# EasyEDA Pro project ProPrj_电刺激+主控_2026-05-06.epro, board PCB1
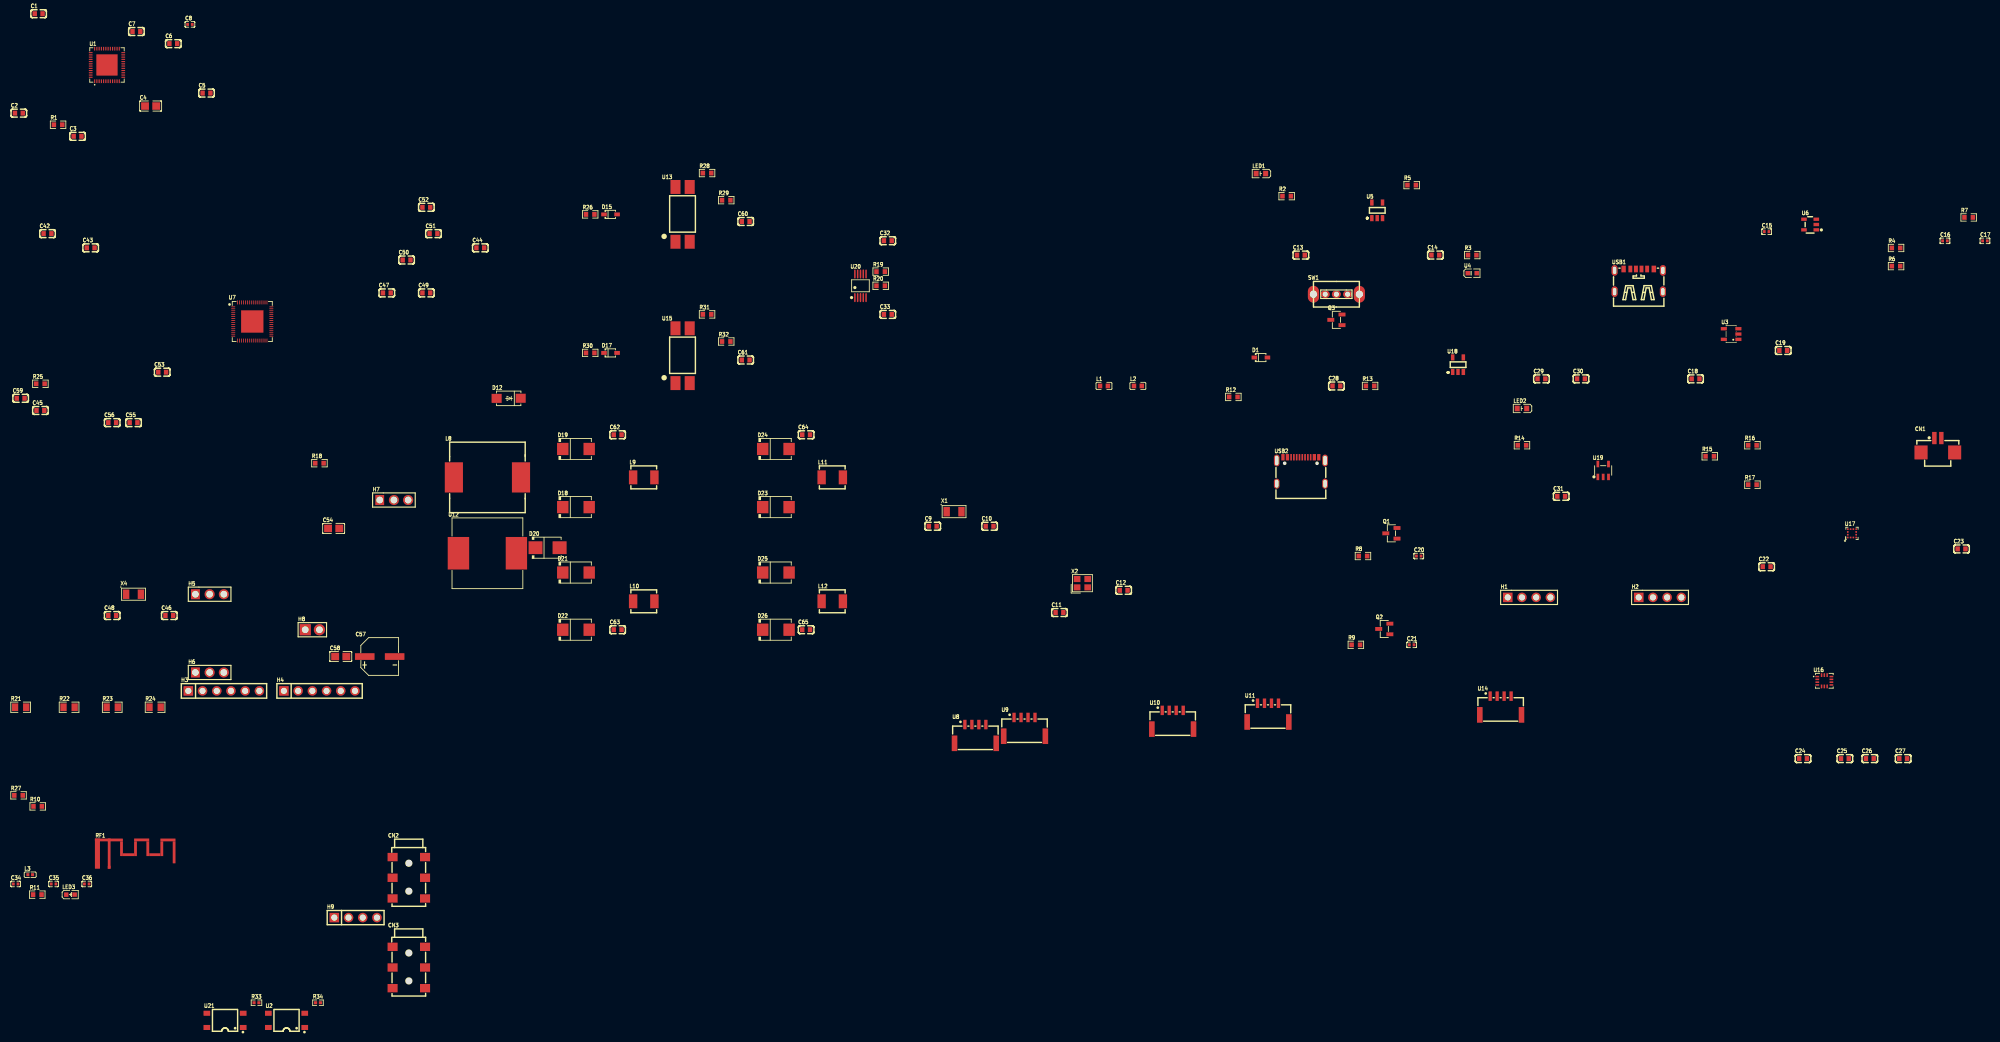
[diagram p2: board, top side]
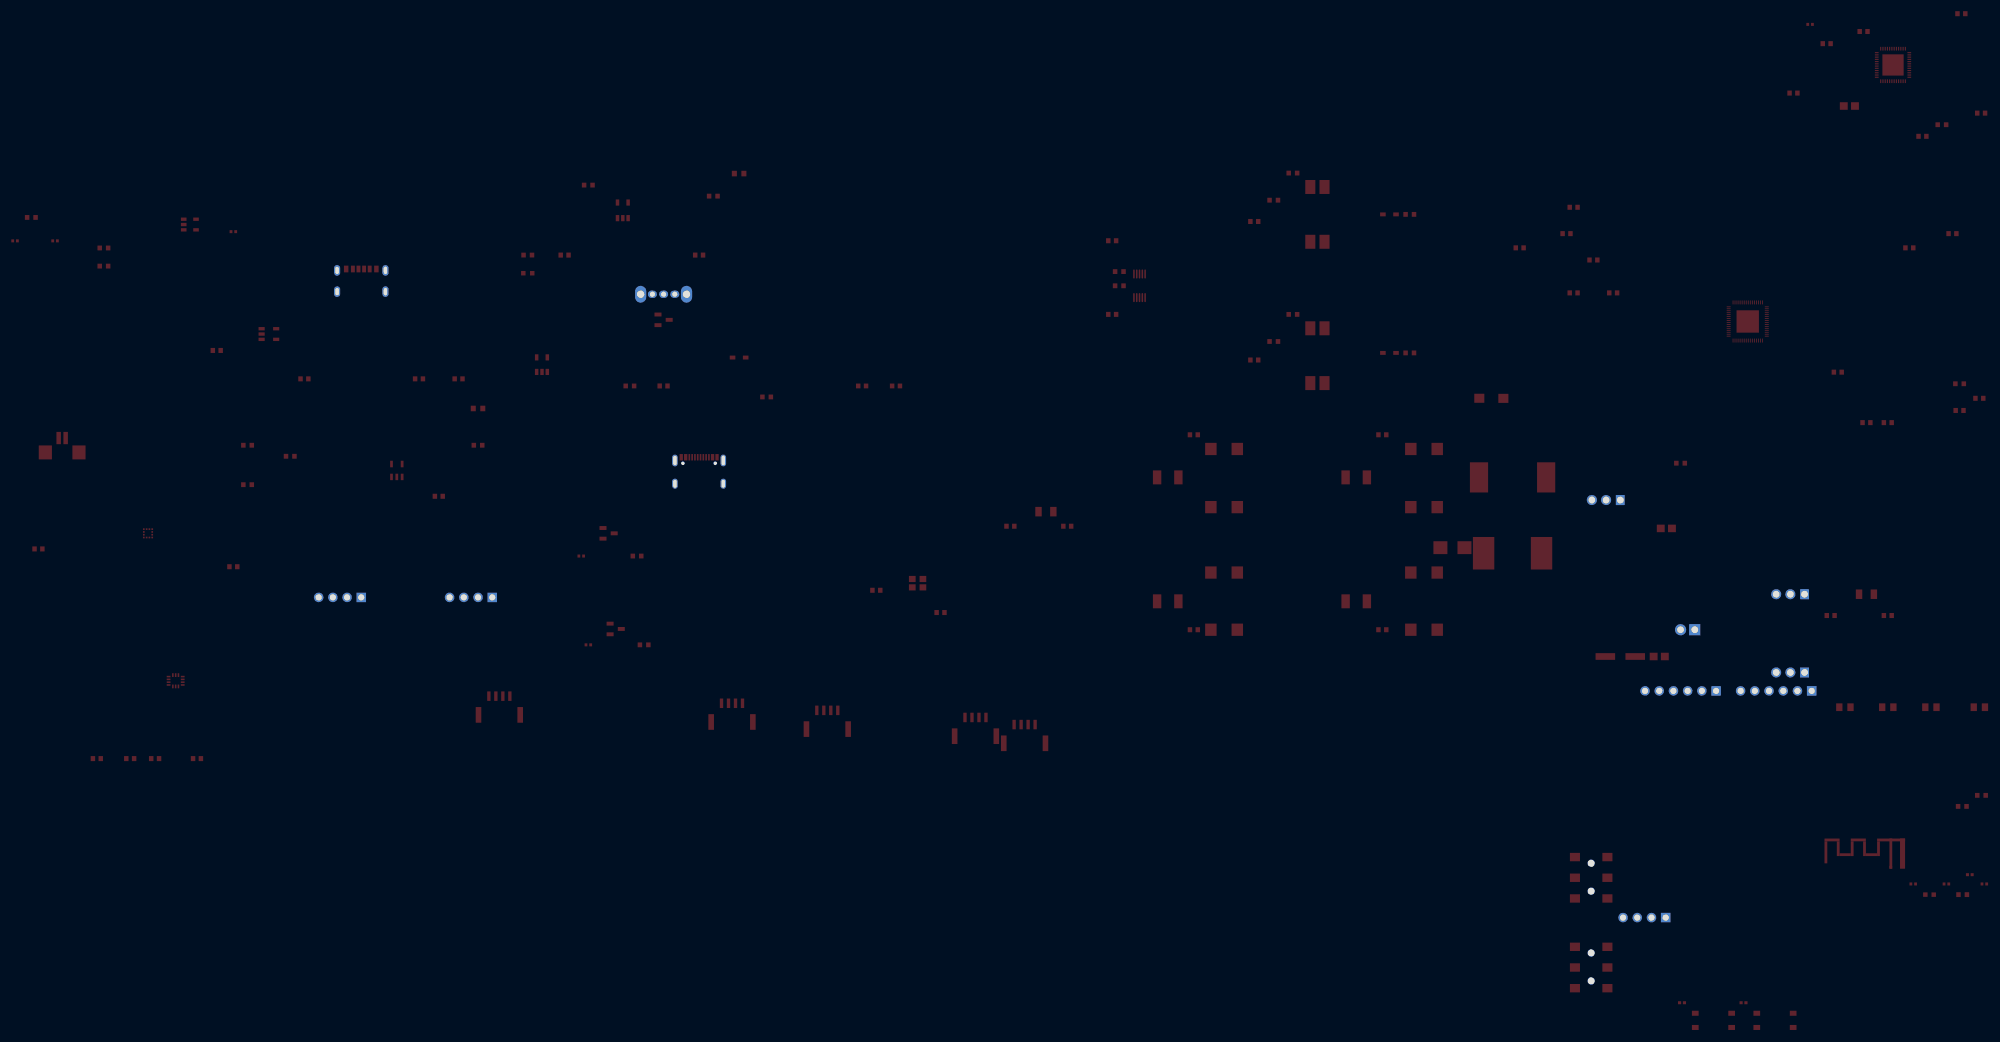
[diagram p3: board, bottom side, seen from below]

Outline 163.28 x 93.55 mm; copper layers: Top Layer, Bottom Layer. Coordinates in mm from the lower left corner of the outline.
Stack: Top Layer 0.035mm / Dielectric1 1.51mm FR4 er 4.5 / Bottom Layer 0.035mm

## Design rules (mm)
spacing copperThickness1oz (default): track to track 0.102, other pairs 0.152 to 0.3
spacing copperThickness2oz: track to track 0.203, other pairs 0.152 to 0.3
track width copperThickness1oz (default): min 0.127, default 0.254, max 2.54
track width copperThickness2oz: min 0.203, default 0.254, max 2.54
differential pair differentialPair (default): width min 0.127, default 0.254, max 2.54; gap min 0.152, default 0.152

## Placement (name value [footprint] x y rotation side)
C1  100nF  [C0603]  -65.51 173.62 0 top
C2  100nF  [C0603]  -69.05 155.84 0 top
C3  100nF  [C0603]  -58.56 151.7 0 top
C4  NC  [C0805]  -45.5 157.11 0 top
C5  100pF  [C0603]  -35.51 159.43 0 top
C6  100nF  [C0603]  -41.44 168.27 0 top
C7  1uF  [C0603]  -48.04 170.44 0 top
C8  10uF  [C0402]  -38.47 171.71 0 top
C9  12pF  [C0603]  94.28 81.96 0 top
C10  12pF  [C0603]  104.44 81.96 0 top
C11  12pF  [C0603]  116.92 66.53 0 top
C12  12pF  [C0603]  128.39 70.51 0 top
C13  4.7uF  [C0603]  160.06 130.46 0 top
C14  4.7uF  [C0603]  184.1 130.46 0 top
C15  10uF  [C0402]  243.3 134.65 0 top
C16  10uF  [C0402]  275.17 133 0 top
C17  10uF  [C0402]  282.32 133 0 top
C18  1uF  [C0603]  230.6 108.32 0 top
C19  1uF  [C0603]  246.27 113.4 0 top
C20  10uF  [C0402]  181.13 76.63 0 top
C21  10uF  [C0402]  179.86 60.75 0 top
C22  220nF  [C0603]  243.3 74.72 0 top
C23  100nF  [C0603]  278.13 77.9 0 top
C24  100nF  [C0603]  249.8 40.41 0 top
C25  100nF  [C0603]  257.28 40.41 0 top
C26  100nF  [C0603]  261.74 40.41 0 top
C27  100nF  [C0603]  267.7 40.41 0 top
C28  10uF  [C0603]  166.41 107.05 0 top
C29  10uF  [C0603]  203.05 108.32 0 top
C30  100nF  [C0603]  210.12 108.32 0 top
C31  10uF  [C0603]  206.59 87.32 0 top
C32  100nF  [C0603]  86.24 133.02 0 top
C33  100nF  [C0603]  86.24 119.85 0 top
C34  0.8pF  [C0402]  -69.61 17.99 0 top
C35  nc  [C0402]  -62.84 17.99 0 top
C36  1.2pF  [C0402]  -56.91 17.99 0 top
C42  100nF  [C0603]  -63.92 134.29 0 top
C43  100nF  [C0603]  -56.21 131.75 0 top
C44  100nF  [C0603]  13.42 131.75 0 top
C45  100nF  [C0603]  -65.19 102.67 0 top
C46  15pF  [C0603]  -42.16 65.99 0 top
C47  1uF  [C0603]  -3.29 123.69 0 top
C48  15pF  [C0603]  -52.36 65.99 0 top
C49  100nF  [C0603]  3.78 123.69 0 top
C50  100nF  [C0603]  0.25 129.58 0 top
C51  1uF  [C0603]  5.05 134.29 0 top
C52  100nF  [C0603]  3.78 139 0 top
C53  100nF  [C0603]  -43.43 109.52 0 top
C54  10uF  [C0805]  -12.79 81.57 0 top
C55  100nF  [C0603]  -48.55 100.49 0 top
C56  100nF  [C0603]  -52.36 100.49 0 top
C57  22uF  [CAP-SMD_BD6.3-L6.6-W6.6-LS7.3-FD-H7.7]  -4.56 58.67 0 top
C58  100nF  [C0805]  -11.52 58.67 0 top
C59  1uF  [C0603]  -68.73 104.84 0 top
C60  10nF  [C0603]  60.85 136.46 0 top
C61  10nF  [C0603]  60.85 111.69 0 top
C62  10nF  [C0603]  37.96 98.32 0 top
C63  10nF  [C0603]  37.96 63.45 0 top
C64  10nF  [C0603]  71.65 98.32 0 top
C65  10nF  [C0603]  71.65 63.45 0 top
CN1  HC-1.25-2PWT  [CONN-SMD_2P-P1.25-HC-1.25-2PWT]  273.9 96.45 0 top
CN2  PJ-242  [AUDIO-SMD_PJ-242_1]  0.65 19.09 0 top
CN3  PJ-242  [AUDIO-SMD_PJ-242_1]  0.65 3.05 0 top
D1  1N5819WS  [SOD-323_L1.8-W1.3-LS2.5-RD]  152.92 112.13 0 top
D12  SS26  [SMA_L4.3-W2.6-LS5.0-FD]  18.49 104.84 0 top
D15  1N4148WS  [SOD-323_L1.8-W1.3-LS2.5-RD]  36.69 137.73 0 top
D17  1N4148WS  [SOD-323_L1.8-W1.3-LS2.5-RD]  36.69 112.96 0 top
D18  SMBJ60A  [SMB_L4.5-W3.7-LS5.4-RD]  30.52 85.38 0 top
D19  SMBJ60A  [SMB_L4.5-W3.7-LS5.4-RD]  30.52 95.78 0 top
D20  SMBJ85A  [SMB_L4.3-W3.6-LS5.3-RD]  25.44 78.13 0 top
D21  SMBJ60A  [SMB_L4.5-W3.7-LS5.4-RD]  30.52 73.68 0 top
D22  SMBJ60A  [SMB_L4.5-W3.7-LS5.4-RD]  30.52 63.45 0 top
D23  SMBJ60A  [SMB_L4.5-W3.7-LS5.4-RD]  66.25 85.38 0 top
D24  SMBJ60A  [SMB_L4.5-W3.7-LS5.4-RD]  66.25 95.78 0 top
D25  SMBJ60A  [SMB_L4.5-W3.7-LS5.4-RD]  66.25 73.68 0 top
D26  SMBJ60A  [SMB_L4.5-W3.7-LS5.4-RD]  66.25 63.45 0 top
H1  PH2.54-01-04PZD  [HDR-TH_4P-P2.54-V-M-1]  200.85 69.24 0 top
H2  PH2.54-01-04PZD  [HDR-TH_4P-P2.54-V-M-1]  224.25 69.24 0 top
H3  PZ254V-11-06P  [HDR-TH_6P-P2.54-V-M]  -32.41 52.52 0 top
H4  PZ254V-11-06P  [HDR-TH_6P-P2.54-V-M]  -15.33 52.52 0 top
H5  12251103CNG0S115001  [HDR-TH_3P-P2.54-V-M-1]  -34.95 69.8 0 top
H6  12251103CNG0S115001  [HDR-TH_3P-P2.54-V-M-1]  -34.95 55.81 0 top
H7  12251103CNG0S115001  [HDR-TH_3P-P2.54-V-M-1]  -2.02 86.65 0 top
H8  PZ254V-11-02P  [HDR-TH_2P-P2.54-V-M]  -16.6 63.45 0 top
H9  PZ254V-11-04P  [HDR-TH_4P-P2.54-V-M]  -8.86 11.97 0 top
L1  10uH  [L0603]  124.88 107.05 0 top
L2  15uH  [L0603]  130.93 107.05 0 top
L3  3.9nH  [L0402]  -67.02 19.65 0 top
L8  100uH  [IND-SMD_L12.6-W13.5]  14.69 90.7 0 top
L9  22uH  [IND-SMD_L4.6-W4.1-A]  42.63 90.7 0 top
L10  22uH  [IND-SMD_L4.6-W4.1-A]  42.63 68.53 0 top
L11  22uH  [IND-SMD_L4.6-W4.1-A]  76.32 90.7 0 top
L12  22uH  [IND-SMD_L4.6-W4.1-A]  76.32 68.53 0 top
LED1  GL0603UR01  [LED0603-FD]  152.92 145.03 0 top
LED2  GL0603UR01  [LED0603-FD]  199.58 103.02 0 top
LED3  GL0603UB01  [LED0603-RD_BLUE]  -59.82 16.08 0 top
Q1  NX2301P,215  [SOT-23-3_L2.9-W1.3-P1.90-LS2.4-BR]  176.24 80.69 0 top
Q2  NX2301P,215  [SOT-23-3_L2.9-W1.3-P1.90-LS2.4-BR]  174.97 63.59 0 top
Q3  SI2301  [SOT-23-3_L2.9-W1.3-P1.90-LS2.4-BR]  166.41 118.88 0 top
R1  10kΩ  [R0603]  -62.04 153.77 0 top
R2  470Ω  [R0603]  157.52 141 0 top
R3  20kΩ  [R0603]  190.69 130.46 0 top
R4  348kΩ  [R0603]  266.43 131.73 0 top
R5  10kΩ  [R0603]  179.86 142.97 0 top
R6  100kΩ  [R0603]  266.43 128.48 0 top
R7  0Ω  [R0603]  279.4 137.19 0 top
R8  47kΩ  [R0603]  171.16 76.63 0 top
R9  47kΩ  [R0603]  169.89 60.75 0 top
R10  4.7kΩ  [R0603]  -65.68 31.86 0 top
R11  15kΩ  [R0603]  -65.75 16.08 0 top
R12  100kΩ  [R0603]  148 105.08 0 top
R13  10kΩ  [R0603]  172.43 107.05 0 top
R14  1kΩ  [R0603]  199.58 96.45 0 top
R15  4.7kΩ  [R0603]  233.14 94.47 0 top
R16  1.1MΩ  [R0603]  240.76 96.45 0 top
R17  1.1MΩ  [R0603]  240.76 89.39 0 top
R18  0Ω  [R0603]  -15.33 93.24 0 top
R19  1kΩ  [R0603]  84.97 127.5 0 top
R20  1kΩ  [R0603]  84.97 124.96 0 top
R21  0Ω  [R0805]  -68.73 49.59 0 top
R22  0Ω  [R0805]  -60.07 49.59 0 top
R23  0Ω  [R0805]  -52.36 49.59 0 top
R24  0Ω  [R0805]  -44.7 49.59 0 top
R25  10kΩ  [R0603]  -65.19 107.44 0 top
R26  10kΩ  [R0603]  33.06 137.73 0 top
R27  4.7kΩ  [R0603]  -69.1 33.83 0 top
R28  10kΩ  [R0603]  53.95 145.12 0 top
R29  1kΩ  [R0603]  57.37 140.27 0 top
R30  10kΩ  [R0603]  33.06 112.96 0 top
R31  10kΩ  [R0603]  53.95 119.85 0 top
R32  1kΩ  [R0603]  57.37 115 0 top
R33  330Ω  [R0402]  -26.58 -3.26 0 top
R34  330Ω  [R0402]  -15.59 -3.26 0 top
RF1  RF_2.4G_ANT  [天线封装]  -53.95 21.09 0 top
SW1  SS-12D02-VG4  [SW-TH_SS-12D02-VG4]  166.41 123.45 0 top
U1  NRF52832-QFAA-R  [QFN-48_L6.0-W6.0-P0.40-BL-EP3.8]  -53.3 164.46 0 top
U2  KAQY214STLD  [SOP-4_L3.9-W4.4-P2.54-LS7.0-BR]  -21.21 -6.41 0 top
U3  AP2127K-1.8TRG1  [SOT-23-5_L3.0-W1.7-P0.95-LS2.8-BR]  236.95 116.34 0 top
U4  PSC-1608U52GC-G4  [LED0603-RD_GREEN]  190.69 127.21 0 top
U5  XC6802A42XMR-G  [SOT-25-5_L3.0-W1.8-P0.95-LS3.0-BL]  173.7 138.46 0 top
U6  JSM2019-ADJYN5G/TR  [SOT-23-5_L2.9-W1.6-P0.95-LS2.8-BR]  251.07 135.92 0 top
U7  NNC6121  [QFN-64_L7.0-W7.0-P0.35-TL-EP4.0]  -27.33 118.58 0 top
U8  WAFER-GH1.25-4PLB  [CONN-SMD_4P-P1.25_XUNPU_WAFER-GH1.25-4PLB]  101.9 44.82 0 top
U9  WAFER-GH1.25-4PLB  [CONN-SMD_4P-P1.25_XUNPU_WAFER-GH1.25-4PLB]  110.68 46.09 0 top
U10  WAFER-GH1.25-4PLB  [CONN-SMD_4P-P1.25_XUNPU_WAFER-GH1.25-4PLB]  137.16 47.36 0 top
U11  WAFER-GH1.25-4PLB  [CONN-SMD_4P-P1.25_XUNPU_WAFER-GH1.25-4PLB]  154.19 48.63 0 top
U12  470uH  [IND-SMD_L12.5-W12.5]  14.69 77.13 0 top
U13  LTV816D-S  [SOP-4_L6.5-W4.6-P2.54-LS10.2-BL]  49.57 137.73 0 top
U14  WAFER-GH1.25-4PLB  [CONN-SMD_4P-P1.25_XUNPU_WAFER-GH1.25-4PLB]  195.77 49.9 0 top
U15  LTV816D-S  [SOP-4_L6.5-W4.6-P2.54-LS10.2-BL]  49.57 112.46 0 top
U16  LSM6DS3TR-C  [LGA-14_L3.0-W2.5-P0.50-TL]  253.61 54.33 0 top
U17  LIS2MDLTR  [VLGA-12_L2.0-W2.0-P0.50-BL]  258.55 80.69 0 top
U18  AP2112K-3.3TRG1  [SOT-25-5_L2.9-W1.6-P0.95-LS2.8-BL]  188.15 110.86 0 top
U19  MCP73831T-2ACI/OT  [SOT-23-5_L3.0-W1.7-P0.95-LS2.8-BL]  214.09 91.93 0 top
U20  CH340E  [MSOP-10_L3.0-W3.0-P0.50-LS5.0-BL]  81.36 124.96 0 top
U21  KAQY214STLD  [SOP-4_L3.9-W4.4-P2.54-LS7.0-BR]  -32.2 -6.41 0 top
USB1  TYPE-C 6P  [TYPE-C-SMD_TYPE-C-6P_1]  220.44 125.94 0 top
USB2  TYPE-C16PIN  [USB-C-SMD_TYPE-C16PIN]  160.06 91.93 0 top
X1  32.768kHz  [OSC-SMD_2P-L3.2-W1.5]  98.09 84.57 0 top
X2  32MHz  [CRYSTAL-SMD_4P-L2.5-W2.0-BL]  121.02 71.78 0 top
X4  32.768kHz  [OSC-SMD_2P-L3.2-W1.5]  -48.55 69.8 0 top

## Footprints (pads in the part's own frame, mm; a bottom-side part is the same pattern mirrored in y, then rotated)
AUDIO-SMD_PJ-242_1
  rect 1.8x1.5 smd: 2(2.9,3.7) 3(-2.9,3.7) 4(2.9,0) 5(2.9,-3.7) 6(-2.9,0) 7(-2.9,-3.7)
C0402
  rect 0.5x0.54 smd: 1(-0.42,0) 2(0.42,0)
C0603
  rect 0.8x0.9 smd: 1(-0.7,0) 2(0.7,0)
C0805
  rect 1.41x1.35 smd: 1(-1,0) 2(1,0)
CAP-SMD_BD6.3-L6.6-W6.6-LS7.3-FD-H7.7
  rect 3.5x1.2 smd: 1(-2.67,0) 2(2.67,0)
CONN-SMD_2P-P1.25-HC-1.25-2PWT
  rect 0.8x2.2 smd: 1(-0.625,1.285) 2(0.625,1.285)
  rect 2.35x2.5 smd: 3(-3.005,-1.285) 4(3.005,-1.285)
CONN-SMD_4P-P1.25_XUNPU_WAFER-GH1.25-4PLB
  rect 0.6x1.7 smd: 1(-1.875,1.675) 2(-0.625,1.675) 3(0.625,1.675) 4(1.875,1.675)
  rect 1x2.8 smd: 5(-3.725,-1.675) 6(3.725,-1.675)
CRYSTAL-SMD_4P-L2.5-W2.0-BL
  rect 1.2x1.1 smd: 1(-0.95,-0.75) 2(0.95,-0.75) 3(0.95,0.75) 4(-0.95,0.75)
HDR-TH_2P-P2.54-V-M
  rect 2x2 hole 1.2: 1(-1.27,0)
  round 2 hole 1.2: 2(1.27,0)
HDR-TH_3P-P2.54-V-M-1
  rect 1.575x1.8 hole 1.2: 1(-2.54,0)
  round 1.8 hole 1.2: 2(0,0) 3(2.54,0)
HDR-TH_4P-P2.54-V-M
  rect 1.7x1.7 hole 1.1: 1(-3.81,0)
  round 1.7 hole 1.1: 2(-1.27,0) 3(1.27,0) 4(3.81,0)
HDR-TH_4P-P2.54-V-M-1
  rect 1.7x1.7 hole 1.1: 1(-3.81,0)
  round 1.7 hole 1.1: 2(-1.27,0) 3(1.27,0) 4(3.81,0)
HDR-TH_6P-P2.54-V-M
  rect 1.7x1.7 hole 1.1: 1(-6.35,0)
  round 1.7 hole 1.1: 2(-3.81,0) 3(-1.27,0) 4(1.27,0) 5(3.81,0) 6(6.35,0)
IND-SMD_L4.6-W4.1-A
  rect 1.5x2.5 smd: 1(-1.9,0) 2(1.9,0)
IND-SMD_L12.5-W12.5
  rect 3.824x5.82 smd: 1(5.178,0) 2(-5.178,0)
IND-SMD_L12.6-W13.5
  rect 3.25x5.4 smd: 1(-6,0) 2(6,0)
L0402
  rect 0.54x0.54 smd: 1(-0.42,0) 2(0.42,0)
L0603
  rect 0.8x0.864 smd: 1(-0.7,0) 2(0.7,0)
LED0603-FD
  rect 0.9x1 smd: 1(-0.85,0) 2(0.85,0)
LED0603-RD_BLUE
  rect 0.8x0.8 smd: 1(-0.749,-0.004) 2(0.749,0.004)
LED0603-RD_GREEN
  rect 0.8x0.8 smd: 1(-0.799,-0.004) 2(0.799,0.004)
LGA-14_L3.0-W2.5-P0.50-TL
  rect 0.675x0.28 smd: 1(-1.262,0.75) 2(-1.262,0.25) 3(-1.262,-0.25) 4(-1.262,-0.75) 8(1.262,-0.75) 9(1.262,-0.25) 10(1.262,0.25) 11(1.262,0.75)
  rect 0.28x0.675 smd: 5(-0.5,-1.012) 6(0,-1.012) 7(0.5,-1.012) 12(0.5,1.012) 13(0,1.012) 14(-0.5,1.012)
MSOP-10_L3.0-W3.0-P0.50-LS5.0-BL
  oval 0.28x1.62 smd: 1(-1,-2.11) 2(-0.5,-2.11) 3(0,-2.11) 4(0.5,-2.11) 5(1,-2.11) 6(1,2.11) 7(0.5,2.11) 8(0,2.11) 9(-0.5,2.11) 10(-1,2.11)
OSC-SMD_2P-L3.2-W1.5
  rect 1.15x1.7 smd: 1(-1.325,0) 2(1.325,0)
QFN-48_L6.0-W6.0-P0.40-BL-EP3.8
  rect 0.2x0.665 smd: 1(-2.2,-2.908) 2(-1.8,-2.908) 3(-1.4,-2.908) 4(-1,-2.908) 5(-0.6,-2.908) 6(-0.2,-2.908) 7(0.2,-2.908) 8(0.6,-2.908) 9(1,-2.908) 10(1.4,-2.908) 11(1.8,-2.908) 12(2.2,-2.908) 25(2.2,2.908) 26(1.8,2.908) 27(1.4,2.908) 28(1,2.908) 29(0.6,2.908) 30(0.2,2.908) 31(-0.2,2.908) 32(-0.6,2.908) 33(-1,2.908) 34(-1.4,2.908) 35(-1.8,2.908) 36(-2.2,2.908)
  rect 0.665x0.2 smd: 13(2.908,-2.2) 14(2.908,-1.8) 15(2.908,-1.4) 16(2.908,-1) 17(2.908,-0.6) 18(2.908,-0.2) 19(2.908,0.2) 20(2.908,0.6) 21(2.908,1) 22(2.908,1.4) 23(2.908,1.8) 24(2.908,2.2) 37(-2.908,2.2) 38(-2.908,1.8) 39(-2.908,1.4) 40(-2.908,1) 41(-2.908,0.6) 42(-2.908,0.2) 43(-2.908,-0.2) 44(-2.908,-0.6) 45(-2.908,-1) 46(-2.908,-1.4) 47(-2.908,-1.8) 48(-2.908,-2.2)
  rect 3.8x3.8 smd: 49(0,0)
QFN-64_L7.0-W7.0-P0.35-TL-EP4.0
  oval 0.74x0.15 smd: 1(-3.408,2.625) 2(-3.408,2.275) 3(-3.408,1.925) 4(-3.408,1.575) 5(-3.408,1.225) 6(-3.408,0.875) 7(-3.408,0.525) 8(-3.408,0.175) 9(-3.408,-0.175) 10(-3.408,-0.525) 11(-3.408,-0.875) 12(-3.408,-1.225) 13(-3.408,-1.575) 14(-3.408,-1.925) 15(-3.408,-2.275) 16(-3.408,-2.625) 33(3.408,-2.625) 34(3.408,-2.275) 35(3.408,-1.925) 36(3.408,-1.575) 37(3.408,-1.225) 38(3.408,-0.875) 39(3.408,-0.525) 40(3.408,-0.175) 41(3.408,0.175) 42(3.408,0.525) 43(3.408,0.875) 44(3.408,1.225) 45(3.408,1.575) 46(3.408,1.925) 47(3.408,2.275) 48(3.408,2.625)
  oval 0.15x0.74 smd: 17(-2.625,-3.408) 18(-2.275,-3.408) 19(-1.925,-3.408) 20(-1.575,-3.408) 21(-1.225,-3.408) 22(-0.875,-3.408) 23(-0.525,-3.408) 24(-0.175,-3.408) 25(0.175,-3.408) 26(0.525,-3.408) 27(0.875,-3.408) 28(1.225,-3.408) 29(1.575,-3.408) 30(1.925,-3.408) 31(2.275,-3.408) 32(2.625,-3.408) 49(2.625,3.408) 50(2.275,3.408) 51(1.925,3.408) 52(1.575,3.408) 53(1.225,3.408) 54(0.875,3.408) 55(0.525,3.408) 56(0.175,3.408) 57(-0.175,3.408) 58(-0.525,3.408) 59(-0.875,3.408) 60(-1.225,3.408) 61(-1.575,3.408) 62(-1.925,3.408) 63(-2.275,3.408) 64(-2.625,3.408)
  rect 4x4 smd: 65(0,0)
R0402
  rect 0.566x0.54 smd: 1(-0.433,0) 2(0.433,0)
R0603
  rect 0.806x0.864 smd: 1(-0.753,0) 2(0.753,0)
R0805
  rect 1.133x1.377 smd: 1(-1,0) 2(1,0)
SMA_L4.3-W2.6-LS5.0-FD
  rect 1.8x1.62 smd: 1(-2.15,-0.009) 2(2.15,0.009)
SMB_L4.3-W3.6-LS5.3-RD
  rect 2.5x2.3 smd: 1(-2.15,0) 2(2.15,0)
SMB_L4.5-W3.7-LS5.4-RD
  rect 2.047x2.192 smd: 1(-2.361,0) 2(2.361,0)
SOD-323_L1.8-W1.3-LS2.5-RD
  rect 1x0.7 smd: 1(-1.173,0) 2(1.173,0)
SOP-4_L3.9-W4.4-P2.54-LS7.0-BR
  rect 1.199x0.9 smd: 1(3.25,-1.27) 2(3.25,1.27) 3(-3.25,1.27) 4(-3.25,-1.27)
SOP-4_L6.5-W4.6-P2.54-LS10.2-BL
  rect 1.8x2.5 smd: 1(-1.27,-4.9) 2(1.27,-4.9) 3(1.27,4.9) 4(-1.27,4.9)
SOT-23-3_L2.9-W1.3-P1.90-LS2.4-BR
  rect 1.25x0.7 smd: 1(1,-0.95) 2(1,0.95) 3(-1,0)
SOT-23-5_L2.9-W1.6-P0.95-LS2.8-BR
  rect 1x0.6 smd: 1(1.1,-0.95) 2(1.1,0) 3(1.1,0.95) 4(-1.1,0.95) 5(-1.1,-0.95)
SOT-23-5_L3.0-W1.7-P0.95-LS2.8-BL
  rect 0.49x1.157 smd: 1(-0.95,-1.153) 2(0,-1.153) 3(0.95,-1.153)
  rect 0.49x1.175 smd: 4(0.95,1.153) 5(-0.95,1.153)
SOT-23-5_L3.0-W1.7-P0.95-LS2.8-BR
  rect 1.1x0.6 smd: 1(1.3,-0.95) 2(1.3,0) 3(1.3,0.95) 4(-1.3,0.95) 5(-1.3,-0.95)
SOT-25-5_L2.9-W1.6-P0.95-LS2.8-BL
  rect 0.623x1.105 smd: 1(-0.95,-1.3) 2(-0.001,-1.3) 3(0.95,-1.3) 4(0.95,1.3) 5(-0.95,1.3)
SOT-25-5_L3.0-W1.8-P0.95-LS3.0-BL
  rect 0.623x1.105 smd: 1(-0.95,-1.397) 2(0,-1.397) 3(0.95,-1.397) 4(0.95,1.397) 5(-0.95,1.397)
SW-TH_SS-12D02-VG4
  oval 1.6x1.3 hole 0.9: 1(-2,0) 2(-0.006,0) 3(2,0)
  oval 2x3 hole 1.3: 4(4.1,0) 5(-4.1,0)
TYPE-C-SMD_TYPE-C-6P_1
  oval 1.1x1.9 hole 0.6x1.3: 7(-4.32,1.775) 7(-4.32,-2.025) 7(4.32,1.775) 7(4.32,-2.025)
  rect 0.7x1.2 smd: A5(-0.5,2.025) A9(1.5,2.025) B5(0.5,2.025) B9(-1.5,2.025)
  rect 0.8x1.2 smd: A12(2.7,2.025) B12(-2.7,2.025)
USB-C-SMD_TYPE-C16PIN
  oval 1x2.1 hole 0.6x1.7: 1(-4.32,1.788) 2(4.32,1.788)
  oval 1x1.8 hole 0.6x1.4: 3(-4.32,-2.362) 4(4.32,-2.362)
  rect 0.6x1.15 smd: A1B12(-3.2,2.362) A4B9(-2.4,2.362) B1A12(3.2,2.362) B4A9(2.4,2.362)
  rect 0.3x1.15 smd: A5(-1.25,2.362) A6(-0.25,2.362) A7(0.25,2.362) A8(1.25,2.362) B5(1.75,2.362) B6(0.75,2.362) B7(-0.75,2.362) B8(-1.75,2.362)
VLGA-12_L2.0-W2.0-P0.50-BL
  rect 0.3x0.3 smd: 1(-0.75,-0.75) 2(-0.25,-0.75) 3(0.25,-0.75) 4(0.75,-0.75) 5(0.75,-0.25) 6(0.75,0.25) 7(0.75,0.75) 8(0.25,0.75) 9(-0.25,0.75) 10(-0.75,0.75) 11(-0.75,0.25) 12(-0.75,-0.25)
天线封装
  rect 0.5x0.5 smd: 1(1.046,-0.129)
  custom 0.6x0.8 smd: 2(-1.046,0.129)

## Nets
As in the schematic.

Pads without a net: CN2 2 3; CN3 2 3; H2 2; U1 11 12 20 27 44; U3 4; U7 52 53 61 62 63 64; U16 4 9 10 11; U17 2 7 11 12; U18 4; U20 4 5 6; USB1 A5 B5; USB2 A5 A8 B5 B8
